# Altium project Vibration_Datalogger.PrjPcb (part 4 of 7)
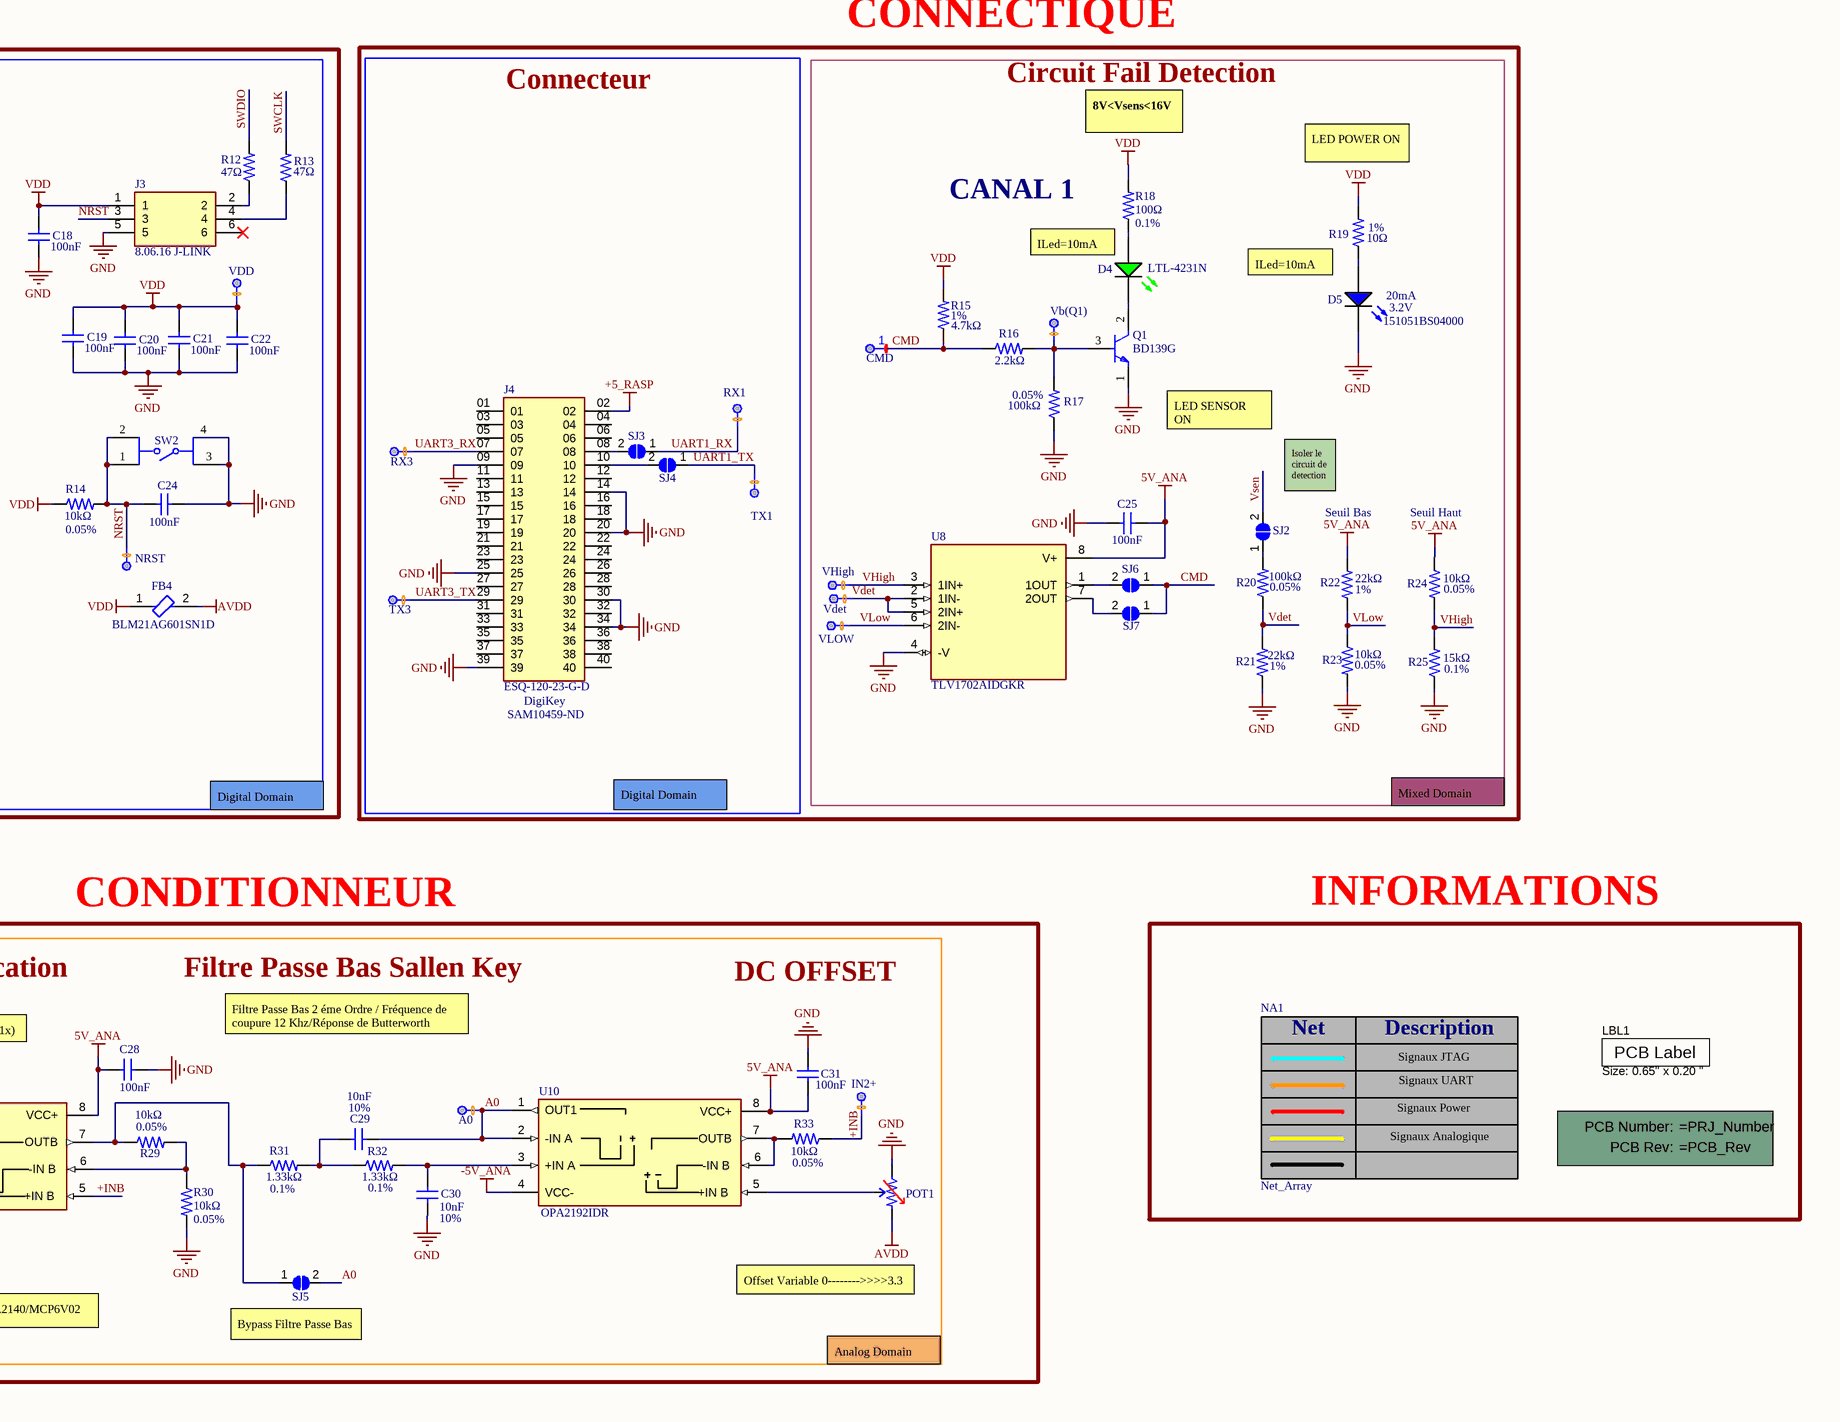
[diagram p6: Vibration_Datalogger_1.SchDoc, bottom right]

## Sheet Vibration_Datalogger_1.SchDoc: Title (continued)

### Library data of the parts (continued)
R1 = RC0402FR-1333KL: RES SMD 33K OHM 0.1% 1/16W 0402; Manufacturer Lifecycle Status: ACTIVE; Part Series: Thin Film Chip Resistors, High Reliability Type; Manufacturer: Panasonic; Manufacturer Part Number: ERA2AEB333X; Max Power Dissipation: 63mW; Temperature Coefficient: 25ppm/°C; Voltage Rating: 25V; Working Voltage: 50V; Case/Package: 0402; Case Code (Imperial): 0402; Case Code (Metric): 1005; China RoHS: Non-Compliant; Composition: Thin Film; Contact Plating: Tin; Depth: 500µm; Height: 350µm; Lead Free: Lead Free; Length: 1mm; Lifecycle Status: Production; Max Operating Temperature: 155°C; Military Standard: Not; Min Operating Temperature: -55°C; Mount: Surface Mount; Number of Pins: 2; Number of Terminals: 2; Number of Terminations: 2; Packaging: Cut Tape; Power Rating: 63mW; Radiation Hardening: No; Ratings: AEC-Q200; REACH SVHC: Yes; Schedule B: 8533210045, 8533210045|8533210045|8533210045|8533210045|8533210045; Termination: SMD/SMT; Voltage Rating (DC): 25V; Width: 500µm; ComponentLink1URL: https://datasheet.octopart.com:443/ERA2AEB333X-Panasonic-datasheet-62287448.pdf?src-supplier=element14+APAC; ComponentLink1Description: https://datasheet.octopart.com:443/ERA2AEB333X-Panasonic-datasheet-62287448.pdf?src-supplier=element14+APAC; ComponentLink2URL: https://datasheet.octopart.com:443/ERA-2AEB333X-Panasonic-datasheet-61114971.pdf?src-supplier=element14+APAC; ComponentLink2Description: https://datasheet.octopart.com:443/ERA-2AEB333X-Panasonic-datasheet-61114971.pdf?src-supplier=element14+APAC; ComponentLink3URL: https://datasheet.octopart.com:443/ERA2AEB333X-Panasonic-datasheet-13266200.pdf?src-supplier=Electro+Sonic; ComponentLink3Description: https://datasheet.octopart.com:443/ERA2AEB333X-Panasonic-datasheet-13266200.pdf?src-supplier=Electro+Sonic; ComponentLink4URL: https://datasheet.octopart.com:443/ERA-2AEB333X-Panasonic-datasheet-33006989.pdf?src-supplier=Electro+Sonic; ComponentLink4Description: https://datasheet.octopart.com:443/ERA-2AEB333X-Panasonic-datasheet-33006989.pdf?src-supplier=Electro+Sonic; ComponentLink5URL: https://datasheet.octopart.com:443/ERA-2AEB333X-Panasonic-datasheet-46744048.pdf?src-supplier=Electro+Sonic; ComponentLink5Description: https://datasheet.octopart.com:443/ERA-2AEB333X-Panasonic-datasheet-46744048.pdf?src-supplier=Electro+Sonic; ComponentLink6URL: https://datasheet.octopart.com:443/ERA2AEB333X-Panasonic-datasheet-12510007.pdf?src-supplier=Future+Electronics; ComponentLink6Description: https://datasheet.octopart.com:443/ERA2AEB333X-Panasonic-datasheet-12510007.pdf?src-supplier=Future+Electronics; ComponentLink7URL: https://datasheet.octopart.com:443/ERA2AEB333X-Panasonic-datasheet-11763931.pdf?src-supplier=Future+Electronics; ComponentLink7Description: https://datasheet.octopart.com:443/ERA2AEB333X-Panasonic-datasheet-11763931.pdf?src-supplier=Future+Electronics; ComponentLink8URL: https://datasheet.octopart.com:443/ERA2AEB333X-Panasonic-datasheet-10840895.pdf?src-supplier=Future+Electronics; ComponentLink8Description: https://datasheet.octopart.com:443/ERA2AEB333X-Panasonic-datasheet-10840895.pdf?src-supplier=Future+Electronics; ComponentLink9URL: https://datasheet.octopart.com:443/ERA2AEB333X-Panasonic-datasheet-8367715.pdf?src-supplier=Future+Electronics; ComponentLink9Description: https://datasheet.octopart.com:443/ERA2AEB333X-Panasonic-datasheet-8367715.pdf?src-supplier=Future+Electronics; ComponentLink10URL: https://datasheet.octopart.com:443/ERA2AEB333X-Panasonic-datasheet-5392808.pdf?src-supplier=Future+Electronics; ComponentLink10Description: https://datasheet.octopart.com:443/ERA2AEB333X-Panasonic-datasheet-5392808.pdf?src-supplier=Future+Electronics; ComponentLink11URL: https://datasheet.octopart.com:443/ERA2AEB333X-Panasonic-datasheet-136531316.pdf?src-supplier=Newark; ComponentLink11Description: https://datasheet.octopart.com:443/ERA2AEB333X-Panasonic-datasheet-136531316.pdf?src-supplier=Newark; ComponentLink12URL: https://datasheet.octopart.com:443/ERA2AEB333X-Panasonic---ECG-datasheet-22087624.pdf?src-supplier=Newark; ComponentLink12Description: https://datasheet.octopart.com:443/ERA2AEB333X-Panasonic---ECG-datasheet-22087624.pdf?src-supplier=Newark; ComponentLink13URL: https://datasheet.octopart.com:443/ERA2AEB333X-Panasonic-datasheet-184398012.pdf?src-supplier=JRH+Electronics; ComponentLink13Description: https://datasheet.octopart.com:443/ERA2AEB333X-Panasonic-datasheet-184398012.pdf?src-supplier=JRH+Electronics; ComponentLink14URL: https://datasheet.octopart.com:443/ERA-2AEB333X-Panasonic-datasheet-154766165.pdf?src-supplier=Master+Electronics; ComponentLink14Description: https://datasheet.octopart.com:443/ERA-2AEB333X-Panasonic-datasheet-154766165.pdf?src-supplier=Master+Electronics; ComponentLink15URL: https://datasheet.octopart.com:443/ERA2AEB333X-Panasonic-datasheet-5311861.pdf?src-supplier=element14; ComponentLink15Description: https://datasheet.octopart.com:443/ERA2AEB333X-Panasonic-datasheet-5311861.pdf?src-supplier=element14; ComponentLink16URL: https://datasheet.octopart.com:443/ERA2AEB333X-Panasonic-datasheet-188913046.pdf?src-supplier=TME; ComponentLink16Description: https://datasheet.octopart.com:443/ERA2AEB333X-Panasonic-datasheet-188913046.pdf?src-supplier=TME; ComponentLink17URL: https://datasheet.octopart.com:443/ERA2AEB333X-Panasonic-datasheet-182736486.pdf?src-supplier=HQonline; ComponentLink17Description: https://datasheet.octopart.com:443/ERA2AEB333X-Panasonic-datasheet-182736486.pdf?src-supplier=HQonline; ComponentLink18URL: https://sigma.octopart.com:443/150570796/technical_drawing/Panasonic-ERA2AEB333X.pdf?src-supplier=Panasonic+SCT; ComponentLink18Description: https://sigma.octopart.com:443/150570796/technical_drawing/Panasonic-ERA2AEB333X.pdf?src-supplier=Panasonic+SCT; ComponentLink19URL: https://datasheet.octopart.com/ERA2AEB333X-Panasonic-datasheet-78375410.pdf; ComponentLink19Description: https://datasheet.octopart.com/ERA2AEB333X-Panasonic-datasheet-78375410.pdf; ComponentLink20URL: https://datasheet.octopart.com:443/ERA2AEB333X-Panasonic-datasheet-10050158.pdf?src-supplier=Arrow+Electronics; ComponentLink20Description: https://datasheet.octopart.com:443/ERA2AEB333X-Panasonic-datasheet-10050158.pdf?src-supplier=Arrow+Electronics; ComponentLink21URL: https://datasheet.octopart.com:443/ERA2AEB333X-Panasonic-datasheet-7542722.pdf?src-supplier=Farnell; ComponentLink21Description: https://datasheet.octopart.com:443/ERA2AEB333X-Panasonic-datasheet-7542722.pdf?src-supplier=Farnell; Supplier 1: Newark; Supplier Part Number 1: ERA2AEB333X; Category: Chip SMD Resistors
R2 = RC0603FR-071K8L: RES 1.8K OHM 1% 1/10W 0603; Max Power Dissipation: 100mW; Temperature Coefficient: 100ppm/°C; Voltage Rating: 75V; Voltage Rating (AC): 50V; Case/Package: 0603; Case Code (Imperial): 0603; China RoHS: Non-Compliant; Composition: Thick Film; Contact Plating: Tin; Depth: 800µm; Features: Moisture Resistant; Height: 450µm; Lead Free: Lead Free; Length: 1.6mm; Lifecycle Status: Production; Max Operating Temperature: 155°C; Military Standard: Not; Min Operating Temperature: -55°C; Mount: Surface Mount; Number of Pins: 2; Number of Terminals: 2; Number of Terminations: 2; Packaging: Cut Tape; Power Rating: 100mW; Radiation Hardening: No; REACH SVHC: Yes; Schedule B: 8533210045, 8533210045|8533210045, 8533210045|8533210045|8533210045, 8533210045|8533210045|8533210045|8533210045; Termination: SMD/SMT; Voltage Rating (DC): 50V; Width: 800µm; Working Voltage: 75V; ComponentLink1URL: https://datasheet.octopart.com:443/RC0603FR-071K8L-Yageo-datasheet-175887523.pdf?src-supplier=IHS; ComponentLink1Description: https://datasheet.octopart.com:443/RC0603FR-071K8L-Yageo-datasheet-175887523.pdf?src-supplier=IHS; ComponentLink2URL: https://datasheet.octopart.com:443/RC0603FR-071K8L-Yageo-datasheet-141265859.pdf?src-supplier=Upverter; ComponentLink2Description: https://datasheet.octopart.com:443/RC0603FR-071K8L-Yageo-datasheet-141265859.pdf?src-supplier=Upverter; ComponentLink3URL: https://datasheet.octopart.com:443/RC0603FR-071K8L-Yageo-datasheet-103092701.pdf?src-supplier=Upverter; ComponentLink3Description: https://datasheet.octopart.com:443/RC0603FR-071K8L-Yageo-datasheet-103092701.pdf?src-supplier=Upverter; ComponentLink4URL: https://datasheet.octopart.com:443/RC0603FR-071K8L-Yageo-Group-datasheet-190305687.pdf?src-supplier=Future+Electronics; ComponentLink4Description: https://datasheet.octopart.com:443/RC0603FR-071K8L-Yageo-Group-datasheet-190305687.pdf?src-supplier=Future+Electronics; ComponentLink5URL: https://datasheet.octopart.com:443/RC0603FR-071K8L-Yageo-datasheet-164759695.pdf?src-supplier=Future+Electronics; ComponentLink5Description: https://datasheet.octopart.com:443/RC0603FR-071K8L-Yageo-datasheet-164759695.pdf?src-supplier=Future+Electronics; ComponentLink6URL: https://datasheet.octopart.com:443/RC0603FR-071K8L-Yageo-datasheet-137700087.pdf?src-supplier=Future+Electronics; ComponentLink6Description: https://datasheet.octopart.com:443/RC0603FR-071K8L-Yageo-datasheet-137700087.pdf?src-supplier=Future+Electronics; ComponentLink7URL: https://datasheet.octopart.com:443/RC0603FR-071K8L-Yageo-datasheet-27584510.pdf?src-supplier=Future+Electronics; ComponentLink7Description: https://datasheet.octopart.com:443/RC0603FR-071K8L-Yageo-datasheet-27584510.pdf?src-supplier=Future+Electronics; ComponentLink8URL: https://datasheet.octopart.com:443/RC0603FR-071K8L-Yageo-datasheet-15599030.pdf?src-supplier=Future+Electronics; ComponentLink8Description: https://datasheet.octopart.com:443/RC0603FR-071K8L-Yageo-datasheet-15599030.pdf?src-supplier=Future+Electronics; ComponentLink9URL: https://datasheet.octopart.com:443/RC0603FR-071K8L-Yageo-datasheet-12596169.pdf?src-supplier=Future+Electronics; ComponentLink9Description: https://datasheet.octopart.com:443/RC0603FR-071K8L-Yageo-datasheet-12596169.pdf?src-supplier=Future+Electronics; ComponentLink10URL: https://datasheet.octopart.com:443/RC0603FR-071K8L-Yageo-datasheet-8324193.pdf?src-supplier=Future+Electronics; ComponentLink10Description: https://datasheet.octopart.com:443/RC0603FR-071K8L-Yageo-datasheet-8324193.pdf?src-supplier=Future+Electronics; ComponentLink11URL: https://datasheet.octopart.com:443/RC0603FR-071K8L-Yageo-datasheet-8328172.pdf?src-supplier=Newark; ComponentLink11Description: https://datasheet.octopart.com:443/RC0603FR-071K8L-Yageo-datasheet-8328172.pdf?src-supplier=Newark; ComponentLink12URL: https://datasheet.octopart.com:443/RC0603FR-071K8L-Yageo-datasheet-62067350.pdf?src-supplier=Newark; ComponentLink12Description: https://datasheet.octopart.com:443/RC0603FR-071K8L-Yageo-datasheet-62067350.pdf?src-supplier=Newark; ComponentLink13URL: https://datasheet.octopart.com:443/RC0603FR-071K8L-Yageo-Group-datasheet-176638170.pdf?src-supplier=Newark; ComponentLink13Description: https://datasheet.octopart.com:443/RC0603FR-071K8L-Yageo-Group-datasheet-176638170.pdf?src-supplier=Newark; ComponentLink14URL: https://datasheet.octopart.com:443/RC0603FR-071K8L-Yageo-datasheet-34211833.pdf?src-supplier=Farnell; ComponentLink14Description: https://datasheet.octopart.com:443/RC0603FR-071K8L-Yageo-datasheet-34211833.pdf?src-supplier=Farnell; ComponentLink15URL: https://datasheet.octopart.com:443/RC0603FR-071K8L-Yageo-datasheet-148775077.pdf?src-supplier=TME; ComponentLink15Description: https://datasheet.octopart.com:443/RC0603FR-071K8L-Yageo-datasheet-148775077.pdf?src-supplier=TME; ComponentLink16URL: https://datasheet.octopart.com:443/RC0603FR-071K8L-Yageo-datasheet-79472498.pdf?src-supplier=Megastar; ComponentLink16Description: https://datasheet.octopart.com:443/RC0603FR-071K8L-Yageo-datasheet-79472498.pdf?src-supplier=Megastar; ComponentLink17URL: https://datasheet.octopart.com/RC0603FR-071K8L-Yageo-datasheet-73766026.pdf; ComponentLink17Description: https://datasheet.octopart.com/RC0603FR-071K8L-Yageo-datasheet-73766026.pdf; ComponentLink18URL: https://datasheet.octopart.com:443/RC0603FR-071K8L-Yageo-datasheet-30459151.pdf?src-supplier=Seeed+Studio; ComponentLink18Description: https://datasheet.octopart.com:443/RC0603FR-071K8L-Yageo-datasheet-30459151.pdf?src-supplier=Seeed+Studio; ComponentLink19URL: https://datasheet.octopart.com:443/RC0603FR-071K8L-Yageo-datasheet-118562.pdf?src-supplier=DigiKey; ComponentLink19Description: https://datasheet.octopart.com:443/RC0603FR-071K8L-Yageo-datasheet-118562.pdf?src-supplier=DigiKey; ComponentLink20URL: http://sigma.octopart.com:80/conflict_mineral_statement/Yageo-company-3.pdf?src-supplier=Compliance+Statements; ComponentLink20Description: http://sigma.octopart.com:80/conflict_mineral_statement/Yageo-company-3.pdf?src-supplier=Compliance+Statements; ComponentLink21URL: http://sigma.octopart.com:80/rohs_statement/Yageo-company-2.pdf?src-supplier=Compliance+Statements; ComponentLink21Description: http://sigma.octopart.com:80/rohs_statement/Yageo-company-2.pdf?src-supplier=Compliance+Statements; Supplier 1: DigiKey; Supplier Part Number 1: 311-1.80KHRDKR-ND
R3 R5 R11 R14 R23 R24 R28-R30 R33 = RG2012N-103-W-T1: RES SMD 10K OHM 0.05% 1/8W 0805; Max Power Dissipation: 125mW; Power Dissipation: 100mW; Temperature Coefficient: 10ppm/°C; Voltage Rating: 100V; Voltage Rating (DC): 150V; Case/Package: 0805; Case Code (Imperial): 0805; Case Code (Metric): 2012; Composition: Thin Film; Country of Origin: Mainland China, Japan; Export Control Classification Number (ECCN) Code: EAR99; Features: Automotive AEC-Q200; Height: 508µm; Harmonized Tariff Schedule (HTS) Code: 8533.21.00.30; Introduction Date: 2007-03-26; Lead Free: Lead Free; Length: 2.0066mm; Lifecycle Status: Obsolete; Max Operating Temperature: 155°C; Min Operating Temperature: -55°C; Mount: Surface Mount; Number of Terminals: 2; Number of Terminations: 2; Packaging: Cut Tape; Schedule B: 8533210045, 8533210045|8533210045|8533210045|8533210045|8533210045; Termination: SMD/SMT; Width: 1.2446mm; Working Voltage: 100V; ComponentLink1URL: https://datasheet.octopart.com:443/RG2012N-103-W-T1-Susumu-datasheet-62085167.pdf?src-supplier=Upverter; ComponentLink1Description: https://datasheet.octopart.com:443/RG2012N-103-W-T1-Susumu-datasheet-62085167.pdf?src-supplier=Upverter; ComponentLink2URL: https://datasheet.octopart.com:443/RG2012N-103-W-T1-Susumu-datasheet-12510102.pdf?src-supplier=IHS; ComponentLink2Description: https://datasheet.octopart.com:443/RG2012N-103-W-T1-Susumu-datasheet-12510102.pdf?src-supplier=IHS; ComponentLink3URL: https://datasheet.octopart.com/RG2012N-103-W-T1-Susumu-datasheet-12509734.pdf; ComponentLink3Description: https://datasheet.octopart.com/RG2012N-103-W-T1-Susumu-datasheet-12509734.pdf; ComponentLink4URL: https://datasheet.octopart.com:443/RG2012N-103-W-T1-Susumu-datasheet-80324142.pdf?src-supplier=Future+Electronics; ComponentLink4Description: https://datasheet.octopart.com:443/RG2012N-103-W-T1-Susumu-datasheet-80324142.pdf?src-supplier=Future+Electronics; ComponentLink5URL: https://datasheet.octopart.com:443/RG2012N-103-W-T1-Susumu-datasheet-12510050.pdf?src-supplier=Future+Electronics; ComponentLink5Description: https://datasheet.octopart.com:443/RG2012N-103-W-T1-Susumu-datasheet-12510050.pdf?src-supplier=Future+Electronics; ComponentLink6URL: https://datasheet.octopart.com:443/RG2012N-103-W-T1-Susumu-datasheet-8324184.pdf?src-supplier=Future+Electronics; ComponentLink6Description: https://datasheet.octopart.com:443/RG2012N-103-W-T1-Susumu-datasheet-8324184.pdf?src-supplier=Future+Electronics; ComponentLink7URL: https://datasheet.octopart.com:443/RG2012N-103-W-T1-Susumu-datasheet-118552.pdf?src-supplier=DigiKey; ComponentLink7Description: https://datasheet.octopart.com:443/RG2012N-103-W-T1-Susumu-datasheet-118552.pdf?src-supplier=DigiKey; ComponentLink8URL: https://datasheet.octopart.com:443/RG2012N-103-W-T1-Susumu-datasheet-123117.pdf?src-supplier=Factory+Futures; ComponentLink8Description: https://datasheet.octopart.com:443/RG2012N-103-W-T1-Susumu-datasheet-123117.pdf?src-supplier=Factory+Futures; Supplier 1: DigiKey; Supplier Part Number 1: RG20N10.0KWCT-ND
R4 R17 R20 R26 = ERA-3ARW104V: RES SMD 100KOHM 0.05% 1/10W 0603; Manufacturer Lifecycle Status: ACTIVE; Part Series: Thin Film Chip Resistors, High Reliability Type; Manufacturer: Panasonic; Manufacturer Part Number: ERA3ARW104V; Max Power Dissipation: 100mW; Temperature Coefficient: 10ppm/°C; Voltage Rating: 150V; Voltage Rating (DC): 75V; Case/Package: 0603; Case Code (Imperial): 0603; Case Code (Metric): 1608; Composition: Metal Film, Thin Film; Contact Plating: Tin; Depth: 800µm; Height: 450µm; Lead Free: Lead Free; Length: 1.6mm; Lifecycle Status: Production; Max Operating Temperature: 155°C; Military Standard: Not; Min Operating Temperature: -55°C; Mount: Surface Mount; Number of Pins: 2; Number of Terminals: 2; Number of Terminations: 2; Packaging: Cut Tape; Power Dissipation: 100mW; Power Rating: 100mW; Radiation Hardening: No; Ratings: AEC-Q200; REACH SVHC: Yes; Schedule B: 8533210045, 8533210045|8533210045|8533210045|8533210045|8533210045|8533210045|8533210045|8533210045|8533210045|8533210045|8533210045|8533210045|8533210045|8533210045|8533210045|8533210045|8533210045|8533210045|8533210045|8533210045|8533210045|8533210045|8533210045|85; Width: 800µm; Working Voltage: 75V; ComponentLink1URL: https://datasheet.octopart.com:443/ERA3ARW104V-Panasonic-datasheet-181959660.pdf?src-supplier=IHS; ComponentLink1Description: https://datasheet.octopart.com:443/ERA3ARW104V-Panasonic-datasheet-181959660.pdf?src-supplier=IHS; ComponentLink2URL: https://datasheet.octopart.com:443/ERA3ARW104V-Panasonic-datasheet-62287448.pdf?src-supplier=Future+Electronics; ComponentLink2Description: https://datasheet.octopart.com:443/ERA3ARW104V-Panasonic-datasheet-62287448.pdf?src-supplier=Future+Electronics; ComponentLink3URL: https://datasheet.octopart.com:443/ERA3ARW104V-Panasonic-datasheet-136531316.pdf?src-supplier=Newark; ComponentLink3Description: https://datasheet.octopart.com:443/ERA3ARW104V-Panasonic-datasheet-136531316.pdf?src-supplier=Newark; ComponentLink4URL: https://datasheet.octopart.com:443/ERA3ARW104V-Panasonic-datasheet-5310081.pdf?src-supplier=Newark; ComponentLink4Description: https://datasheet.octopart.com:443/ERA3ARW104V-Panasonic-datasheet-5310081.pdf?src-supplier=Newark; ComponentLink5URL: https://datasheet.octopart.com:443/ERA-3ARW104V-Panasonic-datasheet-154766165.pdf?src-supplier=Master+Electronics; ComponentLink5Description: https://datasheet.octopart.com:443/ERA-3ARW104V-Panasonic-datasheet-154766165.pdf?src-supplier=Master+Electronics; ComponentLink6URL: https://datasheet.octopart.com:443/ERA3ARW104V-Panasonic-datasheet-13266200.pdf?src-supplier=Electro+Sonic; ComponentLink6Description: https://datasheet.octopart.com:443/ERA3ARW104V-Panasonic-datasheet-13266200.pdf?src-supplier=Electro+Sonic; ComponentLink7URL: https://datasheet.octopart.com:443/ERA-3ARW104V-Panasonic-datasheet-33006989.pdf?src-supplier=Electro+Sonic; ComponentLink7Description: https://datasheet.octopart.com:443/ERA-3ARW104V-Panasonic-datasheet-33006989.pdf?src-supplier=Electro+Sonic; ComponentLink8URL: https://sigma.octopart.com:443/150570796/technical_drawing/Panasonic-ERA3ARW104V.pdf?src-supplier=Panasonic+SCT; ComponentLink8Description: https://sigma.octopart.com:443/150570796/technical_drawing/Panasonic-ERA3ARW104V.pdf?src-supplier=Panasonic+SCT; ComponentLink9URL: https://datasheet.octopart.com/ERA3ARW104V-Panasonic-datasheet-78375410.pdf; ComponentLink9Description: https://datasheet.octopart.com/ERA3ARW104V-Panasonic-datasheet-78375410.pdf; Supplier 1: DigiKey; Supplier Part Number 1: P100KBECT-ND; Category: Chip SMD Resistors
R6 = RMCF0402FT187K: RES 187K OHM 1% 1/16W 0402; Manufacturer: Stackpole Electronics; Max Power Dissipation: 63mW; Voltage Rating: 50V; Temperature Coefficient: 100ppm/°C; Case/Package: 0402; Case Code (Imperial): 0402; Case Code (Metric): 1005; China RoHS: Non-Compliant; Composition: Thick Film; Contact Plating: Tin; Country of Origin: Japan, Mainland China, Taiwan; Export Control Classification Number (ECCN) Code: EAR99; Features: Automotive AEC-Q200; Height: 300µm; Harmonized Tariff Schedule (HTS) Code: 8533.21.00.30; Introduction Date: 2011-01-07; Lead Free: Lead Free; Length: 1mm; Lifecycle Status: Production; Max Operating Temperature: 155°C; Min Operating Temperature: -55°C; Mount: Surface Mount; Number of Terminals: 2; Number of Terminations: 2; Packaging: Cut Tape (CT); Power Rating: 63mW; Radiation Hardening: No; Ratings: AEC-Q200; REACH SVHC: Yes; Schedule B: 8533210045, 8533210045|8533210045, 8533210045|8533210045|8533210045, 8533210045|8533210045|8533210045|8533210045; Width: 500µm; Working Voltage: 50V; ComponentLink1URL: https://datasheet.octopart.com:443/RMCF0402FT187K-Stackpole-Electronics-datasheet-182148065.pdf?src-supplier=IHS; ComponentLink1Description: https://datasheet.octopart.com:443/RMCF0402FT187K-Stackpole-Electronics-datasheet-182148065.pdf?src-supplier=IHS; ComponentLink2URL: https://datasheet.octopart.com:443/RMCF0402FT187K-Stackpole-Electronics-datasheet-141193804.pdf?src-supplier=Master+Electronics; ComponentLink2Description: https://datasheet.octopart.com:443/RMCF0402FT187K-Stackpole-Electronics-datasheet-141193804.pdf?src-supplier=Master+Electronics; ComponentLink3URL: https://datasheet.octopart.com:443/RMCF0402FT187K-Stackpole-Electronics-datasheet-116606903.pdf?src-supplier=Master+Electronics; ComponentLink3Description: https://datasheet.octopart.com:443/RMCF0402FT187K-Stackpole-Electronics-datasheet-116606903.pdf?src-supplier=Master+Electronics; ComponentLink4URL: https://datasheet.octopart.com:443/RMCF0402FT187K-Stackpole-Electronics-datasheet-189104163.pdf?src-supplier=Master+Electronics; ComponentLink4Description: https://datasheet.octopart.com:443/RMCF0402FT187K-Stackpole-Electronics-datasheet-189104163.pdf?src-supplier=Master+Electronics; ComponentLink5URL: https://datasheet.octopart.com:443/RMCF0402FT187K-Stackpole-Electronics-datasheet-28504820.pdf?src-supplier=Upverter; ComponentLink5Description: https://datasheet.octopart.com:443/RMCF0402FT187K-Stackpole-Electronics-datasheet-28504820.pdf?src-supplier=Upverter; ComponentLink6URL: https://datasheet.octopart.com:443/RMCF0402FT187K-Stackpole-Electronics-datasheet-62091608.pdf?src-supplier=Stackpole+Electronics; ComponentLink6Description: https://datasheet.octopart.com:443/RMCF0402FT187K-Stackpole-Electronics-datasheet-62091608.pdf?src-supplier=Stackpole+Electronics; ComponentLink7URL: https://datasheet.octopart.com:443/RMCF0402FT187K-Stackpole-Electronics-datasheet-12534581.pdf?src-supplier=Stackpole+Electronics; ComponentLink7Description: https://datasheet.octopart.com:443/RMCF0402FT187K-Stackpole-Electronics-datasheet-12534581.pdf?src-supplier=Stackpole+Electronics; ComponentLink8URL: https://datasheet.octopart.com:443/RMCF0402FT187K-Stackpole-Electronics-datasheet-10788263.pdf?src-supplier=Stackpole+Electronics; ComponentLink8Description: https://datasheet.octopart.com:443/RMCF0402FT187K-Stackpole-Electronics-datasheet-10788263.pdf?src-supplier=Stackpole+Electronics; ComponentLink9URL: http://sigma.octopart.com:80/15940719/materials_sheet/Stackpole-Electronics-RMCF0402FT187K.pdf?src-supplier=Compliance+Statements; ComponentLink9Description: http://sigma.octopart.com:80/15940719/materials_sheet/Stackpole-Electronics-RMCF0402FT187K.pdf?src-supplier=Compliance+Statements; ComponentLink10URL: http://sigma.octopart.com:80/141158211/reach_statement/Stackpole-Electronics-RMCF0402FT187K.pdf?src-supplier=Compliance+Statements; ComponentLink10Description: http://sigma.octopart.com:80/141158211/reach_statement/Stackpole-Electronics-RMCF0402FT187K.pdf?src-supplier=Compliance+Statements; ComponentLink11URL: http://sigma.octopart.com:80/141158212/rohs_statement/Stackpole-Electronics-RMCF0402FT187K.pdf?src-supplier=Compliance+Statements; ComponentLink11Description: http://sigma.octopart.com:80/141158212/rohs_statement/Stackpole-Electronics-RMCF0402FT187K.pdf?src-supplier=Compliance+Statements; Supplier 1: DigiKey; Supplier Part Number 1: RMCF0402FT187KCT-ND; Manufacturer Part Number: RMCF0402FT187K; Category: Chip SMD Resistors
R7 = ERA-3AEB302V: RES SMD 3K OHM 0.1% 1/10W 0603; Manufacturer Lifecycle Status: ACTIVE; Part Series: Thin Film Chip Resistors, High Reliability Type; Manufacturer: Panasonic; Manufacturer Part Number: ERA3AEB302V; Max Power Dissipation: 100mW; Temperature Coefficient: 25ppm/°C; Voltage Rating: 75V; Case/Package: 0603; Case Code (Imperial): 0603; Composition: Thin Film; Contact Plating: Tin; Country of Origin: Japan; Depth: 800µm; Export Control Classification Number (ECCN) Code: EAR99; Features: Automotive AEC-Q200; Height: 450µm; Harmonized Tariff Schedule (HTS) Code: 8533.21.00.30; Introduction Date: 2008-03-19; Lead Free: Lead Free; Length: 1.6mm; Lifecycle Status: Production; Max Operating Temperature: 155°C; Military Standard: Not; Min Operating Temperature: -55°C; Mount: Surface Mount; Number of Pins: 2; Number of Terminals: 2; Number of Terminations: 2; Packaging: Cut Tape; Power Rating: 100mW; Radiation Hardening: No; Ratings: AEC-Q200; REACH SVHC: Yes; Schedule B: 8533210045, 8533210045|8533210045|8533210045|8533210045|8533210045|8533210045|8533210045|8533210045|8533210045|8533210045|8533210045|8533210045|8533210045|8533210045|8533210045|8533210045|8533210045|8533210045|8533210045|8533210045|8533210045|8533210045|8533210045|85; Termination: SMD/SMT; Tolerance: 0.1%; Voltage Rating (DC): 75V; Width: 800µm; Working Voltage: 75V; ComponentLink1URL: https://datasheet.octopart.com:443/ERA3AEB302V-Panasonic-datasheet-62287448.pdf?src-supplier=Newark; ComponentLink1Description: https://datasheet.octopart.com:443/ERA3AEB302V-Panasonic-datasheet-62287448.pdf?src-supplier=Newark; ComponentLink2URL: https://datasheet.octopart.com:443/ERA3AEB302V-Panasonic-datasheet-136531316.pdf?src-supplier=Newark; ComponentLink2Description: https://datasheet.octopart.com:443/ERA3AEB302V-Panasonic-datasheet-136531316.pdf?src-supplier=Newark; ComponentLink3URL: https://datasheet.octopart.com:443/ERA3AEB302V-Panasonic-datasheet-8367715.pdf?src-supplier=Newark; ComponentLink3Description: https://datasheet.octopart.com:443/ERA3AEB302V-Panasonic-datasheet-8367715.pdf?src-supplier=Newark; ComponentLink4URL: https://datasheet.octopart.com:443/ERA-3AEB302V-Panasonic-datasheet-61114971.pdf?src-supplier=Newark; ComponentLink4Description: https://datasheet.octopart.com:443/ERA-3AEB302V-Panasonic-datasheet-61114971.pdf?src-supplier=Newark; ComponentLink5URL: https://datasheet.octopart.com:443/ERA3AEB302V-Panasonic-datasheet-181959660.pdf?src-supplier=IHS; ComponentLink5Description: https://datasheet.octopart.com:443/ERA3AEB302V-Panasonic-datasheet-181959660.pdf?src-supplier=IHS; ComponentLink6URL: https://sigma.octopart.com:443/138766958/technical_drawing/Panasonic-ERA3AEB302V.pdf?src-supplier=Upverter; ComponentLink6Description: https://sigma.octopart.com:443/138766958/technical_drawing/Panasonic-ERA3AEB302V.pdf?src-supplier=Upverter; ComponentLink7URL: https://datasheet.octopart.com:443/ERA-3AEB302V-Panasonic-datasheet-118567.pdf?src-supplier=element14; ComponentLink7Description: https://datasheet.octopart.com:443/ERA-3AEB302V-Panasonic-datasheet-118567.pdf?src-supplier=element14; ComponentLink8URL: https://datasheet.octopart.com:443/ERA-3AEB302V-Panasonic-datasheet-13266200.pdf?src-supplier=Future+Electronics; ComponentLink8Description: https://datasheet.octopart.com:443/ERA-3AEB302V-Panasonic-datasheet-13266200.pdf?src-supplier=Future+Electronics; ComponentLink9URL: https://datasheet.octopart.com:443/ERA-3AEB302V-Panasonic-datasheet-12510007.pdf?src-supplier=Future+Electronics; ComponentLink9Description: https://datasheet.octopart.com:443/ERA-3AEB302V-Panasonic-datasheet-12510007.pdf?src-supplier=Future+Electronics; ComponentLink10URL: https://datasheet.octopart.com:443/ERA-3AEB302V-Panasonic-datasheet-11763931.pdf?src-supplier=Future+Electronics; ComponentLink10Description: https://datasheet.octopart.com:443/ERA-3AEB302V-Panasonic-datasheet-11763931.pdf?src-supplier=Future+Electronics; ComponentLink11URL: https://datasheet.octopart.com:443/ERA-3AEB302V-Panasonic-datasheet-10840895.pdf?src-supplier=Future+Electronics; ComponentLink11Description: https://datasheet.octopart.com:443/ERA-3AEB302V-Panasonic-datasheet-10840895.pdf?src-supplier=Future+Electronics; ComponentLink12URL: https://datasheet.octopart.com:443/ERA-3AEB302V-Panasonic-datasheet-5392808.pdf?src-supplier=Future+Electronics; ComponentLink12Description: https://datasheet.octopart.com:443/ERA-3AEB302V-Panasonic-datasheet-5392808.pdf?src-supplier=Future+Electronics; ComponentLink13URL: https://datasheet.octopart.com:443/ERA-3AEB302V-Panasonic-datasheet-154766165.pdf?src-supplier=Master+Electronics; ComponentLink13Description: https://datasheet.octopart.com:443/ERA-3AEB302V-Panasonic-datasheet-154766165.pdf?src-supplier=Master+Electronics; ComponentLink14URL: https://datasheet.octopart.com:443/ERA-3AEB302V-Panasonic-datasheet-46744048.pdf?src-supplier=RS+(Formerly+Allied+Electronics); ComponentLink14Description: https://datasheet.octopart.com:443/ERA-3AEB302V-Panasonic-datasheet-46744048.pdf?src-supplier=RS+(Formerly+Allied+Electronics); ComponentLink15URL: https://datasheet.octopart.com:443/ERA-3AEB302V-Panasonic-datasheet-184398012.pdf?src-supplier=JRH+Electronics; ComponentLink15Description: https://datasheet.octopart.com:443/ERA-3AEB302V-Panasonic-datasheet-184398012.pdf?src-supplier=JRH+Electronics; ComponentLink16URL: https://datasheet.octopart.com:443/ERA3AEB302V-Panasonic-datasheet-188913046.pdf?src-supplier=TME; ComponentLink16Description: https://datasheet.octopart.com:443/ERA3AEB302V-Panasonic-datasheet-188913046.pdf?src-supplier=TME; ComponentLink17URL: https://sigma.octopart.com:443/150570796/technical_drawing/Panasonic-ERA3AEB302V.pdf?src-supplier=Panasonic+SCT; ComponentLink17Description: https://sigma.octopart.com:443/150570796/technical_drawing/Panasonic-ERA3AEB302V.pdf?src-supplier=Panasonic+SCT; ComponentLink18URL: https://datasheet.octopart.com:443/ERA3AEB302V-Panasonic-datasheet-138783076.pdf?src-supplier=Burklin+Elektronik; ComponentLink18Description: https://datasheet.octopart.com:443/ERA3AEB302V-Panasonic-datasheet-138783076.pdf?src-supplier=Burklin+Elektronik; ComponentLink19URL: https://datasheet.octopart.com/ERA3AEB302V-Panasonic-datasheet-78375410.pdf; ComponentLink19Description: https://datasheet.octopart.com/ERA3AEB302V-Panasonic-datasheet-78375410.pdf; ComponentLink20URL: https://datasheet.octopart.com:443/ERA3AEB302V-Panasonic---ECG-datasheet-15994758.pdf?src-supplier=Farnell; ComponentLink20Description: https://datasheet.octopart.com:443/ERA3AEB302V-Panasonic---ECG-datasheet-15994758.pdf?src-supplier=Farnell; ComponentLink21URL: https://datasheet.octopart.com:443/ERA-3AEB302V-Panasonic-datasheet-33006989.pdf?src-supplier=Electro+Sonic; ComponentLink21Description: https://datasheet.octopart.com:443/ERA-3AEB302V-Panasonic-datasheet-33006989.pdf?src-supplier=Electro+Sonic; Supplier 1: DigiKey; Supplier Part Number 1: P3.0KDBCT-ND; Category: Chip SMD Resistors
R8 = CPF0603B16R9E1: CMS CPF 0603 16R9 0.1% 25PPM; Manufacturer Lifecycle Status: ACTIVE; Manufacturer: TE Connectivity; Max Power Dissipation: 63mW; Number of Resistors: 1; Operating Supply Voltage: 50V; Temperature Coefficient: 25ppm/°C; Case/Package: 0603; Case Code (Imperial): 0603; Case Code (Metric): 1608; China RoHS: Compliant; Composition: Thin Film; Contact Plating: Tin; Export Control Classification Number (ECCN) Code: EAR99; ELV: Compliant; Height: 450µm; Harmonized Tariff Schedule (HTS) Code: 8533.21.00.30; Introduction Date: 2009-09-23; Length: 1.55mm; Lifecycle Status: Production; Max Operating Temperature: 155°C; Min Operating Temperature: -55°C; Mount: Surface Mount; Number of Terminals: 2; Number of Terminations: 2; Power Rating: 63mW; Radiation Hardening: No; REACH SVHC: Yes; Termination: Solder; Voltage Rating: 50V; Voltage Rating (DC): 50V; Weight: 2.012816mg; Width: 800µm; Working Voltage: 50V; ComponentLink1URL: https://datasheet.octopart.com:443/CPF0603B16R9E1-TE-Connectivity-datasheet-158231717.pdf?src-supplier=IHS; ComponentLink1Description: https://datasheet.octopart.com:443/CPF0603B16R9E1-TE-Connectivity-datasheet-158231717.pdf?src-supplier=IHS; ComponentLink2URL: https://datasheet.octopart.com:443/CPF0603B16R9E1-TE-Connectivity-datasheet-136771900.pdf?src-supplier=Electro+Sonic; ComponentLink2Description: https://datasheet.octopart.com:443/CPF0603B16R9E1-TE-Connectivity-datasheet-136771900.pdf?src-supplier=Electro+Sonic; ComponentLink3URL: https://datasheet.octopart.com:443/CPF0603B16R9E1-TE-Connectivity-datasheet-78339038.pdf?src-supplier=Newark; ComponentLink3Description: https://datasheet.octopart.com:443/CPF0603B16R9E1-TE-Connectivity-datasheet-78339038.pdf?src-supplier=Newark; ComponentLink4URL: https://datasheet.octopart.com:443/CPF0603B16R9E1-TE-Connectivity-datasheet-62056503.pdf?src-supplier=Newark; ComponentLink4Description: https://datasheet.octopart.com:443/CPF0603B16R9E1-TE-Connectivity-datasheet-62056503.pdf?src-supplier=Newark; ComponentLink5URL: https://datasheet.octopart.com:443/CPF0603B16R9E1-TE-Connectivity-datasheet-11120284.pdf?src-supplier=TE+Connectivity; ComponentLink5Description: https://datasheet.octopart.com:443/CPF0603B16R9E1-TE-Connectivity-datasheet-11120284.pdf?src-supplier=TE+Connectivity; ComponentLink6URL: https://datasheet.octopart.com:443/CPF0603B16R9E1-Tyco-Electronics-datasheet-11120060.pdf?src-supplier=TE+Connectivity; ComponentLink6Description: https://datasheet.octopart.com:443/CPF0603B16R9E1-Tyco-Electronics-datasheet-11120060.pdf?src-supplier=TE+Connectivity; ComponentLink7URL: https://sigma.octopart.com:443/78339064/technical_drawing/TE-Connectivity-CPF0603B16R9E1.pdf?src-supplier=TE+Connectivity; ComponentLink7Description: https://sigma.octopart.com:443/78339064/technical_drawing/TE-Connectivity-CPF0603B16R9E1.pdf?src-supplier=TE+Connectivity; ComponentLink8URL: https://datasheet.octopart.com:443/CPF0603B16R9E1-TE-Connectivity-datasheet-11120073.pdf?src-supplier=TE+Connectivity; ComponentLink8Description: https://datasheet.octopart.com:443/CPF0603B16R9E1-TE-Connectivity-datasheet-11120073.pdf?src-supplier=TE+Connectivity; ComponentLink9URL: https://sigma.octopart.com:443/14691678/technical_drawing/TE-Connectivity-CPF0603B16R9E1.pdf?src-supplier=TE+Connectivity; ComponentLink9Description: https://sigma.octopart.com:443/14691678/technical_drawing/TE-Connectivity-CPF0603B16R9E1.pdf?src-supplier=TE+Connectivity; ComponentLink10URL: https://datasheet.octopart.com:443/CPF0603B16R9E1-Neohm-datasheet-140860410.pdf?src-supplier=Master+Electronics; ComponentLink10Description: https://datasheet.octopart.com:443/CPF0603B16R9E1-Neohm-datasheet-140860410.pdf?src-supplier=Master+Electronics; ComponentLink11URL: https://datasheet.octopart.com:443/CPF0603B16R9E1-TE-Connectivity-datasheet-66077623.pdf?src-supplier=Farnell; ComponentLink11Description: https://datasheet.octopart.com:443/CPF0603B16R9E1-TE-Connectivity-datasheet-66077623.pdf?src-supplier=Farnell; ComponentLink12URL: https://datasheet.octopart.com:443/CPF0603B16R9E1-TE-Connectivity-datasheet-11121106.pdf?src-supplier=Farnell; ComponentLink12Description: https://datasheet.octopart.com:443/CPF0603B16R9E1-TE-Connectivity-datasheet-11121106.pdf?src-supplier=Farnell; ComponentLink13URL: https://datasheet.octopart.com:443/CPF0603B16R9E1-TE-Connectivity-datasheet-16487054.pdf?src-supplier=Farnell; ComponentLink13Description: https://datasheet.octopart.com:443/CPF0603B16R9E1-TE-Connectivity-datasheet-16487054.pdf?src-supplier=Farnell; ComponentLink14URL: http://sigma.octopart.com:80/14692461/rohs_certificate/TE-Connectivity-CPF0603B16R9E1.pdf?src-supplier=Compliance+Statements; ComponentLink14Description: http://sigma.octopart.com:80/14692461/rohs_certificate/TE-Connectivity-CPF0603B16R9E1.pdf?src-supplier=Compliance+Statements; Supplier 1: DigiKey; Supplier Part Number 1: CPF0603B16R9E1-ND; Manufacturer Part Number: CPF0603B16R9E1; Category: Chip SMD Resistors
R9 R15 = RC0402FR-074K7L: RES 4.7K OHM 1% 1/16W 0402; Manufacturer: Yageo Group; Power Rating: 62.5mW; Temperature Coefficient: 100ppm/°C; Voltage Rating: 50V; Case/Package: 0402; Case Code (Imperial): 0402; Case Code (Metric): 1005; China RoHS: Non-Compliant; Composition: Thick Film; Country of Origin: Mainland China, Taiwan; Depth: 500µm; Export Control Classification Number (ECCN) Code: EAR99; Height: 350µm; Harmonized Tariff Schedule (HTS) Code: 8533.21.00.30; Introduction Date: 2008-07-18; Lead Free: Lead Free; Length: 1mm; Lifecycle Status: Production; Max Operating Temperature: 155°C; Military Standard: Not; Min Operating Temperature: -55°C; Mount: Surface Mount; Number of Pins: 2; Number of Terminals: 2; Packaging: Tape & Reel; REACH SVHC: Yes; Schedule B: 8533210045, 8533210045|8533210045, 8533210045|8533210045|8533210045, 8533210045|8533210045|8533210045|8533210045; Termination: SMD/SMT; Voltage Rating (AC): 50V; Voltage Rating (DC): 50V; Width: 500µm; Working Voltage: 50V; ComponentLink1URL: https://datasheet.octopart.com:443/RC0402FR-074K7L-Yageo-datasheet-175887523.pdf?src-supplier=IHS; ComponentLink1Description: https://datasheet.octopart.com:443/RC0402FR-074K7L-Yageo-datasheet-175887523.pdf?src-supplier=IHS; ComponentLink2URL: https://datasheet.octopart.com:443/RC0402FR-074K7L-Yageo-datasheet-103092701.pdf?src-supplier=Upverter; ComponentLink2Description: https://datasheet.octopart.com:443/RC0402FR-074K7L-Yageo-datasheet-103092701.pdf?src-supplier=Upverter; ComponentLink3URL: https://datasheet.octopart.com:443/RC0402FR-074K7L-Yageo-datasheet-98239111.pdf?src-supplier=Upverter; ComponentLink3Description: https://datasheet.octopart.com:443/RC0402FR-074K7L-Yageo-datasheet-98239111.pdf?src-supplier=Upverter; ComponentLink4URL: https://datasheet.octopart.com:443/RC0402FR-074K7L-Yageo-Group-datasheet-190305687.pdf?src-supplier=Future+Electronics; ComponentLink4Description: https://datasheet.octopart.com:443/RC0402FR-074K7L-Yageo-Group-datasheet-190305687.pdf?src-supplier=Future+Electronics; ComponentLink5URL: https://datasheet.octopart.com:443/RC0402FR-074K7L-Yageo-datasheet-164759695.pdf?src-supplier=Future+Electronics; ComponentLink5Description: https://datasheet.octopart.com:443/RC0402FR-074K7L-Yageo-datasheet-164759695.pdf?src-supplier=Future+Electronics; ComponentLink6URL: https://datasheet.octopart.com:443/RC0402FR-074K7L-Yageo-datasheet-137700087.pdf?src-supplier=Future+Electronics; ComponentLink6Description: https://datasheet.octopart.com:443/RC0402FR-074K7L-Yageo-datasheet-137700087.pdf?src-supplier=Future+Electronics; ComponentLink7URL: https://datasheet.octopart.com:443/RC0402FR-074K7L-Yageo-Group-datasheet-190051977.pdf?src-supplier=Newark; ComponentLink7Description: https://datasheet.octopart.com:443/RC0402FR-074K7L-Yageo-Group-datasheet-190051977.pdf?src-supplier=Newark; ComponentLink8URL: https://datasheet.octopart.com:443/RC0402FR-074K7L-Yageo-datasheet-12531192.pdf?src-supplier=Newark; ComponentLink8Description: https://datasheet.octopart.com:443/RC0402FR-074K7L-Yageo-datasheet-12531192.pdf?src-supplier=Newark; ComponentLink9URL: https://datasheet.octopart.com:443/RC0402FR-074K7L-Yageo-datasheet-8324527.pdf?src-supplier=Newark; ComponentLink9Description: https://datasheet.octopart.com:443/RC0402FR-074K7L-Yageo-datasheet-8324527.pdf?src-supplier=Newark; ComponentLink10URL: https://datasheet.octopart.com:443/RC0402FR-074K7L-Yageo-datasheet-10408619.pdf?src-supplier=element14+APAC; ComponentLink10Description: https://datasheet.octopart.com:443/RC0402FR-074K7L-Yageo-datasheet-10408619.pdf?src-supplier=element14+APAC; ComponentLink11URL: https://datasheet.octopart.com:443/RC0402FR-074K7L-Yageo-datasheet-13691069.pdf?src-supplier=element14+APAC; ComponentLink11Description: https://datasheet.octopart.com:443/RC0402FR-074K7L-Yageo-datasheet-13691069.pdf?src-supplier=element14+APAC; ComponentLink12URL: https://datasheet.octopart.com:443/RC0402FR-074K7L-Yageo-datasheet-62067350.pdf?src-supplier=Farnell; ComponentLink12Description: https://datasheet.octopart.com:443/RC0402FR-074K7L-Yageo-datasheet-62067350.pdf?src-supplier=Farnell; ComponentLink13URL: https://datasheet.octopart.com:443/RC0402FR-074K7L-Yageo-datasheet-8329306.pdf?src-supplier=element14; ComponentLink13Description: https://datasheet.octopart.com:443/RC0402FR-074K7L-Yageo-datasheet-8329306.pdf?src-supplier=element14; ComponentLink14URL: https://datasheet.octopart.com:443/RC0402FR-074K7L-Yageo-datasheet-175423674.pdf?src-supplier=SOS+electronic; ComponentLink14Description: https://datasheet.octopart.com:443/RC0402FR-074K7L-Yageo-datasheet-175423674.pdf?src-supplier=SOS+electronic; ComponentLink15URL: https://datasheet.octopart.com:443/RC0402FR-074K7L-Yageo-datasheet-79472498.pdf?src-supplier=Megastar; ComponentLink15Description: https://datasheet.octopart.com:443/RC0402FR-074K7L-Yageo-datasheet-79472498.pdf?src-supplier=Megastar; ComponentLink16URL: https://datasheet.octopart.com/RC0402FR-074K7L-Yageo-datasheet-73766026.pdf; ComponentLink16Description: https://datasheet.octopart.com/RC0402FR-074K7L-Yageo-datasheet-73766026.pdf; ComponentLink17URL: http://sigma.octopart.com:80/conflict_mineral_statement/Yageo-company-3.pdf?src-supplier=Compliance+Statements; ComponentLink17Description: http://sigma.octopart.com:80/conflict_mineral_statement/Yageo-company-3.pdf?src-supplier=Compliance+Statements; ComponentLink18URL: http://sigma.octopart.com:80/rohs_statement/Yageo-company-2.pdf?src-supplier=Compliance+Statements; ComponentLink18Description: http://sigma.octopart.com:80/rohs_statement/Yageo-company-2.pdf?src-supplier=Compliance+Statements; Supplier 1: DigiKey; Supplier Part Number 1: 311-4.7KLRDKR-ND; Manufacturer Part Number: RC0402FR-074K7L; Category: Chip SMD Resistors
R10 R18 = RNCF0603BTE100R: RES SMD 100 OHM 0.1% 1/6W 0603; Manufacturer: Stackpole Electronics; Max Power Dissipation: 100mW; Power Rating: 166mW; Temperature Coefficient: 25ppm/°C; Working Voltage: 100V; Case/Package: 0603; Case Code (Imperial): 0603; Case Code (Metric): 1608; Composition: Thin Film; Contact Plating: Tin; Country of Origin: Taiwan; Export Control Classification Number (ECCN) Code: EAR99; Features: Moisture Resistant; Height: 450µm; Harmonized Tariff Schedule (HTS) Code: 8533.21.00.30; Introduction Date: 2011-06-03; Length: 1.55mm; Lifecycle Status: Production; Max Operating Temperature: 155°C; Min Operating Temperature: -55°C; Mount: Surface Mount; Number of Terminals: 2; Number of Terminations: 2; Packaging: Tape & Reel (TR); Radiation Hardening: No; Ratings: AEC-Q200; REACH SVHC: Yes; Width: 800µm; ComponentLink1URL: https://datasheet.octopart.com:443/RNCF0603BTE100R-Stackpole-Electronics-datasheet-182148124.pdf?src-supplier=IHS; ComponentLink1Description: https://datasheet.octopart.com:443/RNCF0603BTE100R-Stackpole-Electronics-datasheet-182148124.pdf?src-supplier=IHS; ComponentLink2URL: https://datasheet.octopart.com:443/RNCF0603BTE100R-Stackpole-Electronics-datasheet-141158876.pdf?src-supplier=Future+Electronics; ComponentLink2Description: https://datasheet.octopart.com:443/RNCF0603BTE100R-Stackpole-Electronics-datasheet-141158876.pdf?src-supplier=Future+Electronics; ComponentLink3URL: https://datasheet.octopart.com:443/RNCF0603BTE100R-Stackpole-Electronics-datasheet-12511394.pdf?src-supplier=Stackpole+Electronics; ComponentLink3Description: https://datasheet.octopart.com:443/RNCF0603BTE100R-Stackpole-Electronics-datasheet-12511394.pdf?src-supplier=Stackpole+Electronics; ComponentLink4URL: https://datasheet.octopart.com:443/RNCF0603BTE100R-Stackpole-Electronics-datasheet-10788241.pdf?src-supplier=Stackpole+Electronics; ComponentLink4Description: https://datasheet.octopart.com:443/RNCF0603BTE100R-Stackpole-Electronics-datasheet-10788241.pdf?src-supplier=Stackpole+Electronics; ComponentLink5URL: https://datasheet.octopart.com:443/RNCF0603BTE100R-Stackpole-Electronics-datasheet-155966811.pdf?src-supplier=Electro+Sonic; ComponentLink5Description: https://datasheet.octopart.com:443/RNCF0603BTE100R-Stackpole-Electronics-datasheet-155966811.pdf?src-supplier=Electro+Sonic; ComponentLink6URL: https://datasheet.octopart.com:443/RNCF0603BTE100R-Stackpole-Electronics-datasheet-28504821.pdf?src-supplier=Master+Electronics; ComponentLink6Description: https://datasheet.octopart.com:443/RNCF0603BTE100R-Stackpole-Electronics-datasheet-28504821.pdf?src-supplier=Master+Electronics; ComponentLink7URL: https://datasheet.octopart.com/RNCF0603BTE100R-Stackpole-Electronics-datasheet-11755897.pdf; ComponentLink7Description: https://datasheet.octopart.com/RNCF0603BTE100R-Stackpole-Electronics-datasheet-11755897.pdf; ComponentLink8URL: http://sigma.octopart.com:80/15941409/materials_sheet/Stackpole-Electronics-RNCF0603BTE100R.pdf?src-supplier=Compliance+Statements; ComponentLink8Description: http://sigma.octopart.com:80/15941409/materials_sheet/Stackpole-Electronics-RNCF0603BTE100R.pdf?src-supplier=Compliance+Statements; ComponentLink9URL: http://sigma.octopart.com:80/141158211/reach_statement/Stackpole-Electronics-RNCF0603BTE100R.pdf?src-supplier=Compliance+Statements; ComponentLink9Description: http://sigma.octopart.com:80/141158211/reach_statement/Stackpole-Electronics-RNCF0603BTE100R.pdf?src-supplier=Compliance+Statements; ComponentLink10URL: http://sigma.octopart.com:80/141158212/rohs_statement/Stackpole-Electronics-RNCF0603BTE100R.pdf?src-supplier=Compliance+Statements; ComponentLink10Description: http://sigma.octopart.com:80/141158212/rohs_statement/Stackpole-Electronics-RNCF0603BTE100R.pdf?src-supplier=Compliance+Statements; Supplier Part Number 1: 738-RNCF0603BTE100RDKR-ND; Manufacturer Part Number: RNCF0603BTE100R; Category: Chip SMD Resistors; Supplier 1: DigiKey